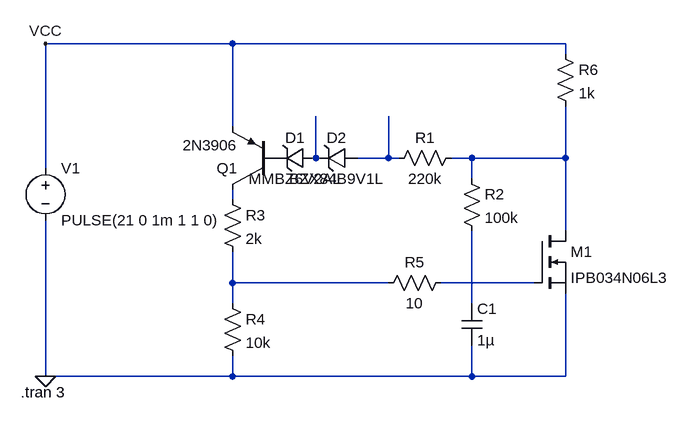
[diagram p0: schematic battery_discharge_protection.asc]
battery_discharge_protection.asc, the LTspice schematic file:
Version 4
SHEET 1 880 680
WIRE 192 -368 -96 -368
WIRE 704 -368 192 -368
WIRE 704 -352 704 -368
WIRE 192 -240 192 -368
WIRE 320 -192 320 -256
WIRE 432 -192 432 -256
WIRE 432 -192 384 -192
WIRE 448 -192 432 -192
WIRE 560 -192 528 -192
WIRE 704 -192 704 -272
WIRE 704 -192 560 -192
WIRE -96 -176 -96 -368
WIRE 560 -160 560 -192
WIRE 192 -128 192 -144
WIRE 704 -80 704 -192
WIRE 192 0 192 -48
WIRE 432 0 192 0
WIRE 656 0 512 0
WIRE 192 32 192 0
WIRE 560 32 560 -80
WIRE -96 144 -96 -96
WIRE 192 144 192 112
WIRE 192 144 -96 144
WIRE 560 144 560 96
WIRE 560 144 192 144
WIRE 704 144 704 16
WIRE 704 144 560 144
FLAG -96 144 0
FLAG -96 -368 VCC
SYMBOL pnp 256 -144 R180
SYMATTR InstName Q1
SYMATTR Value 2N3906
SYMBOL zener 320 -208 R90
WINDOW 0 0 32 VBottom 2
WINDOW 3 32 32 VTop 2
SYMATTR InstName D1
SYMATTR Value MMBZ6V2AL
SYMATTR Description Diode
SYMATTR Type diode
SYMBOL zener 384 -208 R90
WINDOW 0 0 32 VBottom 2
WINDOW 3 32 32 VTop 2
SYMATTR InstName D2
SYMATTR Value BZX84B9V1L
SYMATTR Description Diode
SYMATTR Type diode
SYMBOL nmos 656 -80 R0
SYMATTR InstName M1
SYMATTR Value IPB034N06L3
SYMBOL res 544 -208 R90
WINDOW 0 0 56 VBottom 2
WINDOW 3 32 56 VTop 2
SYMATTR InstName R1
SYMATTR Value 220k
SYMBOL res 544 -176 R0
SYMATTR InstName R2
SYMATTR Value 100k
SYMBOL res 176 -144 R0
SYMATTR InstName R3
SYMATTR Value 2k
SYMBOL res 176 16 R0
SYMATTR InstName R4
SYMATTR Value 10k
SYMBOL res 528 -16 R90
WINDOW 0 0 56 VBottom 2
WINDOW 3 32 56 VTop 2
SYMATTR InstName R5
SYMATTR Value 10
SYMBOL res 688 -368 R0
SYMATTR InstName R6
SYMATTR Value 1k
SYMBOL cap 544 32 R0
SYMATTR InstName C1
SYMATTR Value 1µ
SYMBOL voltage -96 -192 R0
WINDOW 123 0 0 Left 0
WINDOW 39 0 0 Left 0
SYMATTR InstName V1
SYMATTR Value PULSE(21 0 1m 1 1 0)
TEXT -134 168 Left 2 !.tran 3

The netlist it stands for:
* battery_discharge_protection.asc
Q1 N004 P001 VCC 0 2N3906
D1 N001 P001 MMBZ6V2AL
D2 N002 N001 BZX84B9V1L
M1 N003 N006 0 0 IPB034N06L3
R1 N003 N002 220k
R2 N003 N007 100k
R3 N004 N005 2k
R4 N005 0 10k
R5 N006 N005 10
R6 VCC N003 1k
C1 N007 0 1µ
V1 VCC 0 PULSE(21 0 1m 1 1 0)
.model D D
.lib standard.dio
.model NPN NPN
.model PNP PNP
.lib standard.bjt
.model NMOS NMOS
.model PMOS PMOS
.lib standard.mos
.tran 3
.backanno
.end